# Altium project DT10965_MOTOR_CONTROLLER.PrjPcb (part 7 of 8)

## Sheet Pressure_sensor_AFE3.SchDoc: =DT_SCH_Title
size A4; Organization: Droid Technologies; DocumentNumber: DT10965; Revision: 1.0; SheetNumber: 15; SheetTotal: 22
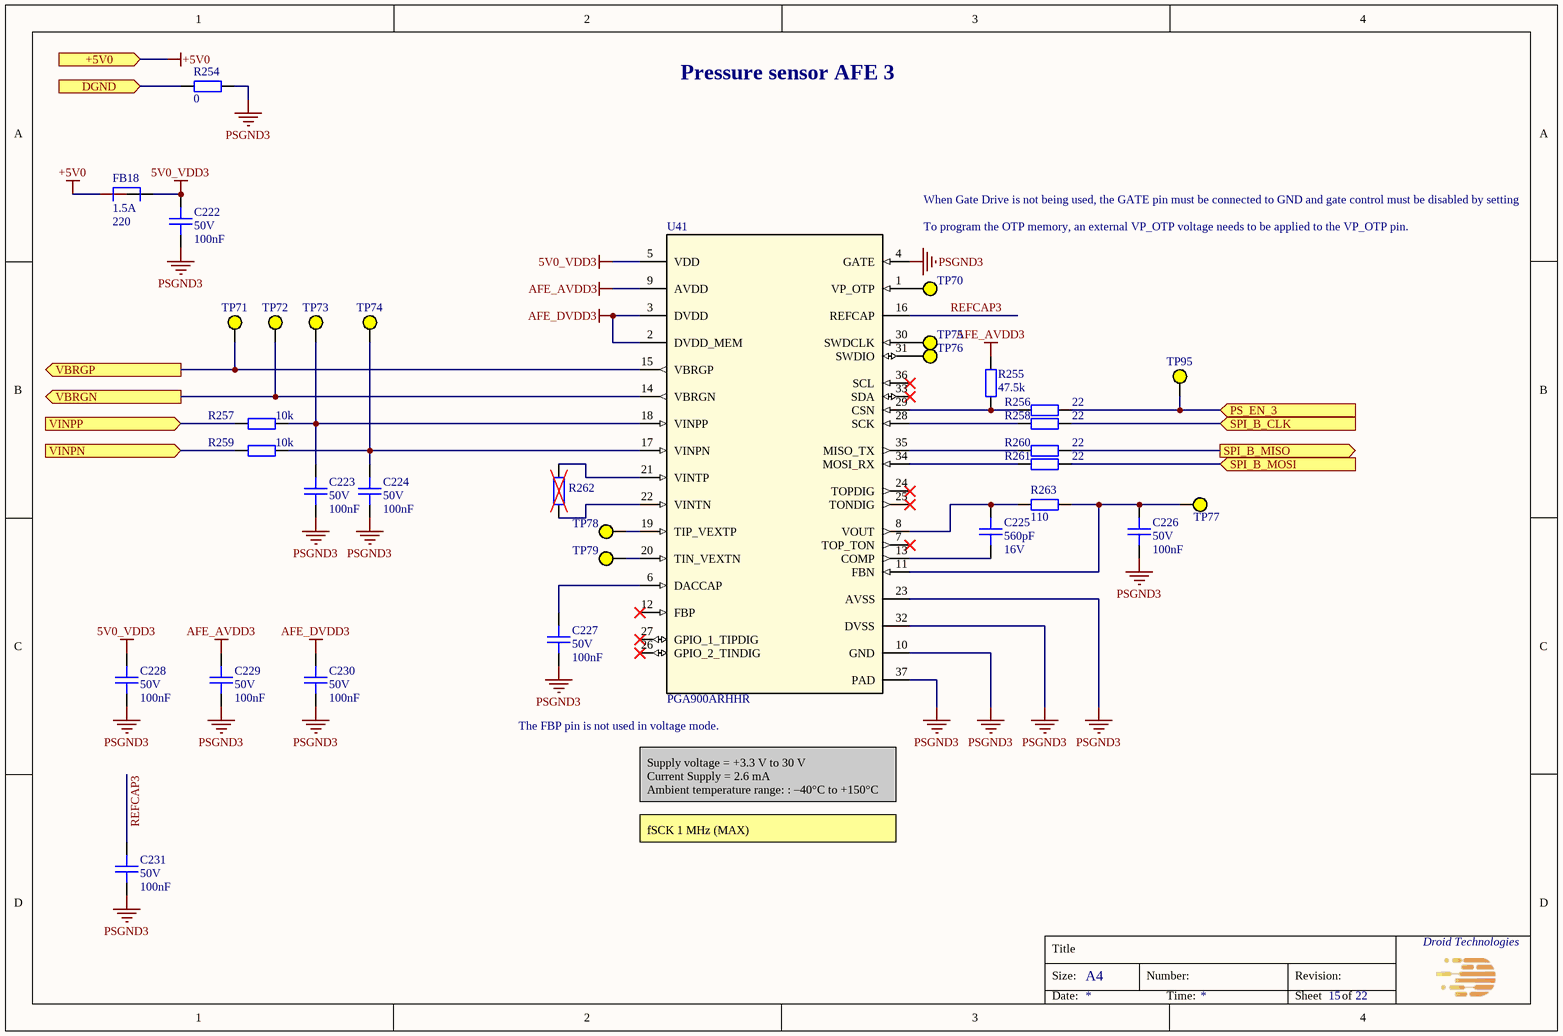
[diagram p16: Pressure_sensor_AFE3.SchDoc]

### Parts
C222  Voltage Rating: 50V  Capacitance: 100nF  [CAPC100x50x50L25]  (hidden comment: GCM155L8EH104KE07D)
C223  Voltage Rating: 50V  Capacitance: 100nF  [CAPC100x50x50L25]  (hidden comment: GCM155L8EH104KE07D)
C224  Voltage Rating: 50V  Capacitance: 100nF  [CAPC100x50x50L25]  (hidden comment: GCM155L8EH104KE07D)
C225  Capacitance: 560pF  Voltage Rating: 16V  [CAPC100x50x50L25]  (hidden comment: C0402C561F4HACAUTO)
C226  Voltage Rating: 50V  Capacitance: 100nF  [CAPC100x50x50L25]  (hidden comment: GCM155L8EH104KE07D)
C227  Voltage Rating: 50V  Capacitance: 100nF  [CAPC100x50x50L25]  (hidden comment: GCM155L8EH104KE07D)
C228  Voltage Rating: 50V  Capacitance: 100nF  [CAPC100x50x50L25]  (hidden comment: GCM155L8EH104KE07D)
C229  Voltage Rating: 50V  Capacitance: 100nF  [CAPC100x50x50L25]  (hidden comment: GCM155L8EH104KE07D)
C230  Voltage Rating: 50V  Capacitance: 100nF  [CAPC100x50x50L25]  (hidden comment: GCM155L8EH104KE07D)
C231  Voltage Rating: 50V  Capacitance: 100nF  [CAPC100x50x50L25]  (hidden comment: GCM155L8EH104KE07D)
FB18  Imax: 1.5A  Impedance: 220  [BEADC160X80X95L40]  (hidden comment: BLM18KG221BH1D)
R254  Resistance: 0  [RESC160X80X55L30]  (hidden comment: RC0603FR-070RL)
R255  Resistance: 47.5k  [RESC100X50X40L25]  (hidden comment: RC0402FR-0747K5L)
R256  Resistance: 22  [RESC100X50X40L25]  (hidden comment: RC0402FR-0722RL)
R257  Resistance: 10k  [RESC100X50X40L25]  (hidden comment: RC0402FR-0710KL)
R258  Resistance: 22  [RESC100X50X40L25]  (hidden comment: RC0402FR-0722RL)
R259  Resistance: 10k  [RESC100X50X40L25]  (hidden comment: RC0402FR-0710KL)
R260  Resistance: 22  [RESC100X50X40L25]  (hidden comment: RC0402FR-0722RL)
R261  Resistance: 22  [RESC100X50X40L25]  (hidden comment: RC0402FR-0722RL)
R262  DNP chip res 0603  [RESC160X80X55L30]  (value not drawn)
R263  Resistance: 110  [RESC100X50X40L25]  (hidden comment: RC0402FR-07110RL)
TP70  Test Point  [TP_D1.5mm]  (value not drawn)  (no BOM)
TP71  Test Point  [TP_D0.75mm]  (value not drawn)  (no BOM)
TP72  Test Point  [TP_D0.75mm]  (value not drawn)  (no BOM)
TP73  Test Point  [TP_D0.75mm]  (value not drawn)  (no BOM)
TP74  Test Point  [TP_D0.75mm]  (value not drawn)  (no BOM)
TP75  Test Point  [TP_D1.5mm]  (value not drawn)  (no BOM)
TP76  Test Point  [TP_D1.5mm]  (value not drawn)  (no BOM)
TP77  Test Point  [TP_D0.75mm]  (value not drawn)  (no BOM)
TP78  Test Point  [TP_D1.5mm]  (value not drawn)  (no BOM)
TP79  Test Point  [TP_D1.5mm]  (value not drawn)  (no BOM)
TP95  Test Point  [TP_D0.75mm]  (value not drawn)  (no BOM)
U41  PGA900ARHHR  [36VQFN]

### Ports
+5V0 (in), DGND (in), PS_EN_3 (in), SPI_B_CLK (in), SPI_B_MISO (out), SPI_B_MOSI (in), VBRGN (out), VBRGP (out), VINPN (in), VINPP (in)

### Nets
5V0_VDD3: C222.2 C228.2 FB18.2 U41.5(VDD)
+5V0: FB18.1 ; port +5V0
AFE_AVDD3: C229.2 R255.2 U41.9(AVDD)
AFE_DVDD3: C230.2 U41.2(DVDD_MEM) U41.3(DVDD)
DGND: R254.2 ; port DGND
PSGND3: C222.1 C223.1 C224.1 C226.1 C227.1 C228.1 C229.1 C230.1 C231.1 R254.1 U41.4(GATE) U41.10(GND) U41.23(AVSS) U41.32(DVSS) U41.37(PAD)
PS_EN_3: R256.2 TP95.1 ; port PS_EN_3
REFCAP3: C231.2 U41.16(REFCAP)
SPI_B_CLK: R258.2 ; port SPI_B_CLK
SPI_B_MISO: R260.2 ; port SPI_B_MISO
SPI_B_MOSI: R261.2 ; port SPI_B_MOSI
NetC223_2: C223.2 R257.2 TP73.1 U41.18(VINPP)
NetC224_2: C224.2 R259.2 TP74.1 U41.17(VINPN)
NetC225_1: C225.1 U41.13(COMP)
NetC225_2: C225.2 R263.1 U41.8(VOUT)
NetC226_2: C226.2 R263.2 TP77.1 U41.11(FBN)
NetC227_2: C227.2 U41.6(DACCAP)
NetR255_1: R255.1 R256.1 U41.29(CSN)
NetR257_1: R257.1 ; port VINPP
NetR258_1: R258.1 U41.28(SCK)
NetR259_1: R259.1 ; port VINPN
NetR260_1: R260.1 U41.35(MISO_TX)
NetR261_1: R261.1 U41.34(MOSI_RX)
NetR262_1: R262.1 U41.22(VINTN)
NetR262_2: R262.2 U41.21(VINTP)
NetTP70_1: TP70.1 U41.1(VP_OTP)
NetTP71_1: TP71.1 U41.15(VBRGP) ; port VBRGP
NetTP72_1: TP72.1 U41.14(VBRGN) ; port VBRGN
NetTP75_1: TP75.1 U41.30(SWDCLK)
NetTP76_1: TP76.1 U41.31(SWDIO)
NetTP78_1: TP78.1 U41.19(TIP_VEXTP)
NetTP79_1: TP79.1 U41.20(TIN_VEXTN)

Not connected (* = marked no-connect by the designer): U41 7(TOP_TON)* 12(FBP)* 24(TOPDIG)* 25(TONDIG)* 26(GPIO_2_TINDIG)* 27(GPIO_1_TIPDIG)* 33(SDA)* 36(SCL)*

### Notes on the sheet
- Pressure sensor AFE 3
- To program the OTP memory, an external VP_OTP voltage needs to be applied to the VP_OTP pin.
- When Gate Drive is not being used, the GATE pin must be connected to GND and gate control must be disabled by setting
- (near U41) The FBP pin is not used in voltage mode.
- Supply voltage = +3.3 V to 30 V
  Current Supply = 2.6 mA
  Ambient temperature range: : –40°C to +150°C
- fSCK 1 MHz (MAX)
- Title
- Size:
- A4
- Number:
- Revision:
- Date:
- Time:
- Sheet
- of

### Library data of the parts
C222-C224 C226-C231 = CMP-001-1980-2: as C174 on sheet Power_management; Height max: 550µm; ComponentLink3Description: Digikey; Mounting Type: SM; ComponentLink3URL: https://www.digikey.com/en/products/detail/murata-electronics/GCM155L8EH104KE07D/11618823; Package: 0402 (1005 Metric); Lead Spacing: 0mm; MPN: GCM155L8EH104KE07D; Size: 1.00mm x 0.50mm; Ratings: AEC-Q200; ComponentLink1URL: https://www.murata.com/en-us/products/productdetail?partno=GCM155L8EH104KE07%23; ComponentLink1Description: Datasheet; Dielectric: X8L; ComponentLink2Description: Mouser; ComponentLink2URL: https://eu.mouser.com/ProductDetail/Murata-Electronics/GCM155L8EH104KE07D?qs=1mbolxNpo8fQSHf0HYnZWw%3D%3D
C225 = CMP-001-2011-2: as C215 on sheet Pressure_sensor_AFE2; Package: 0402 (1005 Metric); MPN: C0402C561F4HACAUTO; ComponentLink3Description: Digikey; Mounting Type: SM; Height max: 550µm; Lead Spacing: 0mm; ComponentLink1Description: Datasheet; ComponentLink3URL: https://www.digikey.com/en/products/detail/kemet/C0402C561F4HACAUTO/7955183?s=N4IgjCBcpgbFoDGUBmBDANgZwKYBoQB7KAbRAGYBOMAVgA4QBdAgBwBcoQBlNgJwEsAdgHMQAXwJgA7AhDJI6bPiKkQAFgBMGzfGYh2nHgJHiCGmhtnzFuAsUhltGyuQh6DkbnyGiJ4SnSUVqiYtioOIAAMTH4akWpB0HIhSnaqNLCRAAQsAGJMrByeAKqC-GwA8igAsjhoWACuvDimIAC0lknyfA3K9mQ0MbHpmSwoMUA; ComponentLink2URL: https://eu.mouser.com/ProductDetail/KEMET/C0402C561F4HACAUTO?qs=j%252B1pi9TdxUZljUlO6hXHJQ%3D%3D; ComponentLink2Description: Mouser; ComponentLink1URL: https://www.kemet.com/en/us/product/C0402C561F4HACAUTO.html; Ratings: AEC-Q200; Size: 1.00mm x 0.50mm
FB18 = CMP-001-1981-1: as FB15 on sheet Power_management; Mounting Type: SM; Size: 1.60mm x 0.80mm; ComponentLink2URL: https://eu.mouser.com/ProductDetail/Murata-Electronics/BLM18KG221BH1D?qs=sJ5gq5MLFXpgEHYBdWUtkQ%3D%3D; ComponentLink1Description: Datasheet; ComponentLink1URL: https://www.murata.com/en-us/products/productdata/8798137286686/QNFA9129.pdf; Lead Spacing: 0mm; Ratings: AEC-Q200; ComponentLink3Description: Digikey; ComponentLink3URL: https://www.digikey.com/en/products/detail/murata-electronics/BLM18KG221BH1D/6156000; Height max: 950µm; Package: 0603 (1608 Metric); ComponentLink2Description: Mouser; MPN: BLM18KG221BH1D
R254 = CMP-001-0927-2: as R244 on sheet Pressure_sensor_AFE2; Height max: 550µm; ComponentLink2URL: https://eu.mouser.com/ProductDetail/YAGEO/RC0603FR-070RL?qs=0yPvnVz5%2FmpDQv43TwvCfw%3D%3D; Temperature Coefficient: -; ComponentLink3Description: Digikey; ComponentLink2Description: Mouser; MPN: RC0603FR-070RL; ComponentLink1URL: https://www.yageo.com/upload/media/product/productsearch/datasheet/rchip/PYu-RC_Group_51_RoHS_L_12.pdf; Ratings: -; Size: 1.60mm x 0.80mm; Composition: Thick Film; Mounting Type: SM; ComponentLink3URL: https://www.digikey.com/en/products/detail/yageo/RC0603FR-070RL/1304008; Package: 0603 (1608 Metric); ComponentLink1Description: Datasheet
R255 = CMP-001-0277-7: as R245 on sheet Pressure_sensor_AFE2; ComponentLink1URL: https://www.yageo.com/upload/media/product/productsearch/datasheet/rchip/PYu-RC_Group_51_RoHS_L_12.pdf; ComponentLink1Description: Datasheet; MPN: RC0402FR-0747K5L; ComponentLink3Description: Digikey; ComponentLink2URL: https://eu.mouser.com/ProductDetail/YAGEO/RC0402FR-0747K5L?qs=V1yeUXFNrklfu86Rfgihxg%3D%3D; Mounting Type: SM; Tolerance: 1%; Package: 0402 (1005 Metric); Height max: 400µm; ComponentLink2Description: Mouser; ComponentLink3URL: https://www.digikey.com/en/products/detail/yageo/RC0402FR-0747K5L/726617; Size: 1.00mm x 0.50mm; Composition: Thick Film; Ratings: -
R256 R258 R260 R261 = CMP-001-0482-4: as R208 on sheet Power_management; Ratings: -; ComponentLink3URL: https://www.digikey.com/en/products/detail/yageo/RC0402FR-0722RL/726562; ComponentLink2URL: https://eu.mouser.com/ProductDetail/YAGEO/RC0402FR-0722RL?qs=V1yeUXFNrkkRg6zf08ADKQ%3D%3D; MPN: RC0402FR-0722RL; ComponentLink1Description: Datasheet; ComponentLink3Description: Digikey; Tolerance: 1%; Size: 1.00mm x 0.50mm; ComponentLink1URL: https://www.yageo.com/upload/media/product/productsearch/datasheet/rchip/PYu-RC_Group_51_RoHS_L_12.pdf; Composition: Thick Film; ComponentLink2Description: Mouser; Mounting Type: SM; Package: 0402 (1005 Metric); Height max: 400µm
R257 R259 = CMP-00010-6: as R247 on sheet Pressure_sensor_AFE2; ComponentLink3URL: https://www.digikey.com/en/products/detail/yageo/RC0402FR-0710KL/726523; ComponentLink1Description: Datasheet; Height max: 400µm; ComponentLink3Description: Digikey; ComponentLink2URL: https://www2.mouser.com/ProductDetail/YAGEO/RC0402FR-0710KL?qs=%2Fha2pyFaduhjtLcYvKXQ8NAGbRXkQ%2Fwl6RsvWHeV66MSeqLhkcF3rg%3D%3D; Ratings: -; MPN: RC0402FR-0710KL; ComponentLink1URL: https://www.yageo.com/upload/media/product/productsearch/datasheet/rchip/PYu-RC_Group_51_RoHS_L_12.pdf; ComponentLink2Description: Mouser; Mounting Type: SM; Tolerance: 1%; Composition: Thick Film; Size: 1.00mm x 0.50mm; Package: 0402 (1005 Metric)
R262 = CMP-001-0920-3: DNP res 0603; Mounting Type: SM; MPN: DNP; Package: 0603 (1608 Metric)
R263 = CMP-001-0497-6: as R253 on sheet Pressure_sensor_AFE2; Size: 1.00mm x 0.50mm; ComponentLink1Description: Datasheet; Package: 0402 (1005 Metric); ComponentLink2URL: https://eu.mouser.com/ProductDetail/YAGEO/RC0402FR-07110RL?qs=QWYorlrD8IXj7iGvwWbRbA%3D%3D; MPN: RC0402FR-07110RL; ComponentLink3Description: Digikey; Height max: 400µm; Ratings: -; ComponentLink3URL: https://www.digikey.com/en/products/detail/yageo/RC0402FR-07110RL/2827583; Composition: Thick Film; ComponentLink2Description: Mouser; Tolerance: 1%; Mounting Type: SM; ComponentLink1URL: https://www.yageo.com/upload/media/product/productsearch/datasheet/rchip/PYu-RC_Group_51_RoHS_L_12.pdf
TP70 TP75 TP76 TP78 TP79 = TP_1.5
TP71-TP74 TP77 TP95 = TP_0.75: Test point 0.75mm
U41 = PGA900ARHHR: as U40 on sheet Pressure_sensor_AFE2; MPN: PGA900ARHHR

## Sheet PGA900_AFE_Reserved_4.SchDoc: =DT_SCH_Title
size A4; Organization: Droid Technologies; DocumentNumber: DT10965; Revision: 1.0; SheetNumber: 16; SheetTotal: 22
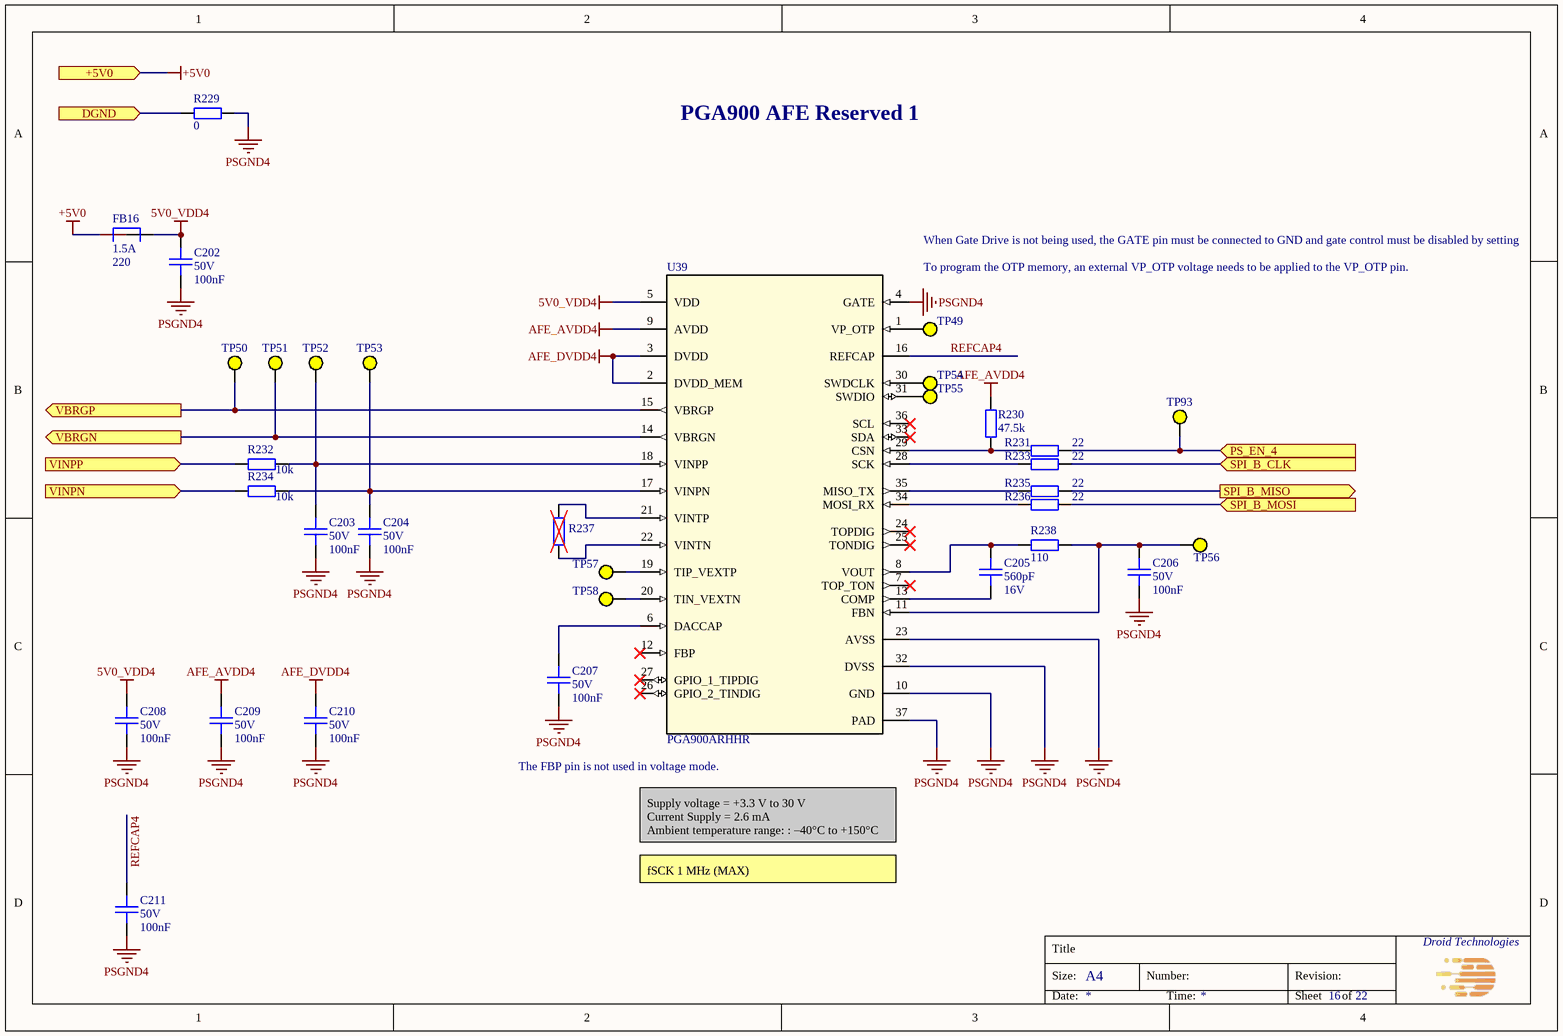
[diagram p17: PGA900_AFE_Reserved_4.SchDoc]

### Parts
C202  Voltage Rating: 50V  Capacitance: 100nF  [CAPC100x50x50L25]  (hidden comment: GCM155L8EH104KE07D)
C203  Voltage Rating: 50V  Capacitance: 100nF  [CAPC100x50x50L25]  (hidden comment: GCM155L8EH104KE07D)
C204  Voltage Rating: 50V  Capacitance: 100nF  [CAPC100x50x50L25]  (hidden comment: GCM155L8EH104KE07D)
C205  Capacitance: 560pF  Voltage Rating: 16V  [CAPC100x50x50L25]  (hidden comment: C0402C561F4HACAUTO)
C206  Voltage Rating: 50V  Capacitance: 100nF  [CAPC100x50x50L25]  (hidden comment: GCM155L8EH104KE07D)
C207  Voltage Rating: 50V  Capacitance: 100nF  [CAPC100x50x50L25]  (hidden comment: GCM155L8EH104KE07D)
C208  Voltage Rating: 50V  Capacitance: 100nF  [CAPC100x50x50L25]  (hidden comment: GCM155L8EH104KE07D)
C209  Voltage Rating: 50V  Capacitance: 100nF  [CAPC100x50x50L25]  (hidden comment: GCM155L8EH104KE07D)
C210  Voltage Rating: 50V  Capacitance: 100nF  [CAPC100x50x50L25]  (hidden comment: GCM155L8EH104KE07D)
C211  Voltage Rating: 50V  Capacitance: 100nF  [CAPC100x50x50L25]  (hidden comment: GCM155L8EH104KE07D)
FB16  Imax: 1.5A  Impedance: 220  [BEADC160X80X95L40]  (hidden comment: BLM18KG221BH1D)
R229  Resistance: 0  [RESC160X80X55L30]  (hidden comment: RC0603FR-070RL)
R230  Resistance: 47.5k  [RESC100X50X40L25]  (hidden comment: RC0402FR-0747K5L)
R231  Resistance: 22  [RESC100X50X40L25]  (hidden comment: RC0402FR-0722RL)
R232  Resistance: 10k  [RESC100X50X40L25]  (hidden comment: RC0402FR-0710KL)
R233  Resistance: 22  [RESC100X50X40L25]  (hidden comment: RC0402FR-0722RL)
R234  Resistance: 10k  [RESC100X50X40L25]  (hidden comment: RC0402FR-0710KL)
R235  Resistance: 22  [RESC100X50X40L25]  (hidden comment: RC0402FR-0722RL)
R236  Resistance: 22  [RESC100X50X40L25]  (hidden comment: RC0402FR-0722RL)
R237  DNP chip res 0603  [RESC160X80X55L30]  (value not drawn)
R238  Resistance: 110  [RESC100X50X40L25]  (hidden comment: RC0402FR-07110RL)
TP49  Test Point  [TP_D1.5mm]  (value not drawn)  (no BOM)
TP50  Test Point  [TP_D0.75mm]  (value not drawn)  (no BOM)
TP51  Test Point  [TP_D0.75mm]  (value not drawn)  (no BOM)
TP52  Test Point  [TP_D0.75mm]  (value not drawn)  (no BOM)
TP53  Test Point  [TP_D0.75mm]  (value not drawn)  (no BOM)
TP54  Test Point  [TP_D1.5mm]  (value not drawn)  (no BOM)
TP55  Test Point  [TP_D1.5mm]  (value not drawn)  (no BOM)
TP56  Test Point  [TP_D0.75mm]  (value not drawn)  (no BOM)
TP57  Test Point  [TP_D1.5mm]  (value not drawn)  (no BOM)
TP58  Test Point  [TP_D1.5mm]  (value not drawn)  (no BOM)
TP93  Test Point  [TP_D0.75mm]  (value not drawn)  (no BOM)
U39  PGA900ARHHR  [36VQFN]

### Ports
+5V0 (in), DGND (in), PS_EN_4 (in), SPI_B_CLK (in), SPI_B_MISO (out), SPI_B_MOSI (in), VBRGN (out), VBRGP (out), VINPN (in), VINPP (in)

### Nets
5V0_VDD4: C202.2 C208.2 FB16.2 U39.5(VDD)
+5V0: FB16.1 ; port +5V0
AFE_AVDD4: C209.2 R230.2 U39.9(AVDD)
AFE_DVDD4: C210.2 U39.2(DVDD_MEM) U39.3(DVDD)
DGND: R229.2 ; port DGND
PSGND4: C202.1 C203.1 C204.1 C206.1 C207.1 C208.1 C209.1 C210.1 C211.1 R229.1 U39.4(GATE) U39.10(GND) U39.23(AVSS) U39.32(DVSS) U39.37(PAD)
PS_EN_4: R231.2 TP93.1 ; port PS_EN_4
REFCAP4: C211.2 U39.16(REFCAP)
SPI_B_CLK: R233.2 ; port SPI_B_CLK
SPI_B_MISO: R235.2 ; port SPI_B_MISO
SPI_B_MOSI: R236.2 ; port SPI_B_MOSI
NetC203_2: C203.2 R232.2 TP52.1 U39.18(VINPP)
NetC204_2: C204.2 R234.2 TP53.1 U39.17(VINPN)
NetC205_1: C205.1 U39.13(COMP)
NetC205_2: C205.2 R238.1 U39.8(VOUT)
NetC206_2: C206.2 R238.2 TP56.1 U39.11(FBN)
NetC207_2: C207.2 U39.6(DACCAP)
NetR230_1: R230.1 R231.1 U39.29(CSN)
NetR232_1: R232.1 ; port VINPP
NetR233_1: R233.1 U39.28(SCK)
NetR234_1: R234.1 ; port VINPN
NetR235_1: R235.1 U39.35(MISO_TX)
NetR236_1: R236.1 U39.34(MOSI_RX)
NetR237_1: R237.1 U39.22(VINTN)
NetR237_2: R237.2 U39.21(VINTP)
NetTP49_1: TP49.1 U39.1(VP_OTP)
NetTP50_1: TP50.1 U39.15(VBRGP) ; port VBRGP
NetTP51_1: TP51.1 U39.14(VBRGN) ; port VBRGN
NetTP54_1: TP54.1 U39.30(SWDCLK)
NetTP55_1: TP55.1 U39.31(SWDIO)
NetTP57_1: TP57.1 U39.19(TIP_VEXTP)
NetTP58_1: TP58.1 U39.20(TIN_VEXTN)

Not connected (* = marked no-connect by the designer): U39 7(TOP_TON)* 12(FBP)* 24(TOPDIG)* 25(TONDIG)* 26(GPIO_2_TINDIG)* 27(GPIO_1_TIPDIG)* 33(SDA)* 36(SCL)*

### Notes on the sheet
- PGA900 AFE Reserved 1
- When Gate Drive is not being used, the GATE pin must be connected to GND and gate control must be disabled by setting
- To program the OTP memory, an external VP_OTP voltage needs to be applied to the VP_OTP pin.
- (near U39) The FBP pin is not used in voltage mode.
- Supply voltage = +3.3 V to 30 V
  Current Supply = 2.6 mA
  Ambient temperature range: : –40°C to +150°C
- fSCK 1 MHz (MAX)
- Title
- Size:
- A4
- Number:
- Revision:
- Date:
- Time:
- Sheet
- of

### Library data of the parts
C202-C204 C206-C211 = CMP-001-1980-2: as C174 on sheet Power_management; Height max: 550µm; ComponentLink3Description: Digikey; Mounting Type: SM; ComponentLink3URL: https://www.digikey.com/en/products/detail/murata-electronics/GCM155L8EH104KE07D/11618823; Package: 0402 (1005 Metric); Lead Spacing: 0mm; MPN: GCM155L8EH104KE07D; Size: 1.00mm x 0.50mm; Ratings: AEC-Q200; ComponentLink1URL: https://www.murata.com/en-us/products/productdetail?partno=GCM155L8EH104KE07%23; ComponentLink1Description: Datasheet; Dielectric: X8L; ComponentLink2Description: Mouser; ComponentLink2URL: https://eu.mouser.com/ProductDetail/Murata-Electronics/GCM155L8EH104KE07D?qs=1mbolxNpo8fQSHf0HYnZWw%3D%3D
C205 = CMP-001-2011-2: as C215 on sheet Pressure_sensor_AFE2; Package: 0402 (1005 Metric); MPN: C0402C561F4HACAUTO; ComponentLink3Description: Digikey; Mounting Type: SM; Height max: 550µm; Lead Spacing: 0mm; ComponentLink1Description: Datasheet; ComponentLink3URL: https://www.digikey.com/en/products/detail/kemet/C0402C561F4HACAUTO/7955183?s=N4IgjCBcpgbFoDGUBmBDANgZwKYBoQB7KAbRAGYBOMAVgA4QBdAgBwBcoQBlNgJwEsAdgHMQAXwJgA7AhDJI6bPiKkQAFgBMGzfGYh2nHgJHiCGmhtnzFuAsUhltGyuQh6DkbnyGiJ4SnSUVqiYtioOIAAMTH4akWpB0HIhSnaqNLCRAAQsAGJMrByeAKqC-GwA8igAsjhoWACuvDimIAC0lknyfA3K9mQ0MbHpmSwoMUA; ComponentLink2URL: https://eu.mouser.com/ProductDetail/KEMET/C0402C561F4HACAUTO?qs=j%252B1pi9TdxUZljUlO6hXHJQ%3D%3D; ComponentLink2Description: Mouser; ComponentLink1URL: https://www.kemet.com/en/us/product/C0402C561F4HACAUTO.html; Ratings: AEC-Q200; Size: 1.00mm x 0.50mm
FB16 = CMP-001-1981-1: as FB15 on sheet Power_management; Mounting Type: SM; Size: 1.60mm x 0.80mm; ComponentLink2URL: https://eu.mouser.com/ProductDetail/Murata-Electronics/BLM18KG221BH1D?qs=sJ5gq5MLFXpgEHYBdWUtkQ%3D%3D; ComponentLink1Description: Datasheet; ComponentLink1URL: https://www.murata.com/en-us/products/productdata/8798137286686/QNFA9129.pdf; Lead Spacing: 0mm; Ratings: AEC-Q200; ComponentLink3Description: Digikey; ComponentLink3URL: https://www.digikey.com/en/products/detail/murata-electronics/BLM18KG221BH1D/6156000; Height max: 950µm; Package: 0603 (1608 Metric); ComponentLink2Description: Mouser; MPN: BLM18KG221BH1D
R229 = CMP-001-0927-2: as R244 on sheet Pressure_sensor_AFE2; Height max: 550µm; ComponentLink2URL: https://eu.mouser.com/ProductDetail/YAGEO/RC0603FR-070RL?qs=0yPvnVz5%2FmpDQv43TwvCfw%3D%3D; Temperature Coefficient: -; ComponentLink3Description: Digikey; ComponentLink2Description: Mouser; MPN: RC0603FR-070RL; ComponentLink1URL: https://www.yageo.com/upload/media/product/productsearch/datasheet/rchip/PYu-RC_Group_51_RoHS_L_12.pdf; Ratings: -; Size: 1.60mm x 0.80mm; Composition: Thick Film; Mounting Type: SM; ComponentLink3URL: https://www.digikey.com/en/products/detail/yageo/RC0603FR-070RL/1304008; Package: 0603 (1608 Metric); ComponentLink1Description: Datasheet
R230 = CMP-001-0277-7: as R245 on sheet Pressure_sensor_AFE2; ComponentLink1URL: https://www.yageo.com/upload/media/product/productsearch/datasheet/rchip/PYu-RC_Group_51_RoHS_L_12.pdf; ComponentLink1Description: Datasheet; MPN: RC0402FR-0747K5L; ComponentLink3Description: Digikey; ComponentLink2URL: https://eu.mouser.com/ProductDetail/YAGEO/RC0402FR-0747K5L?qs=V1yeUXFNrklfu86Rfgihxg%3D%3D; Mounting Type: SM; Tolerance: 1%; Package: 0402 (1005 Metric); Height max: 400µm; ComponentLink2Description: Mouser; ComponentLink3URL: https://www.digikey.com/en/products/detail/yageo/RC0402FR-0747K5L/726617; Size: 1.00mm x 0.50mm; Composition: Thick Film; Ratings: -
R231 R233 R235 R236 = CMP-001-0482-4: as R208 on sheet Power_management; Ratings: -; ComponentLink3URL: https://www.digikey.com/en/products/detail/yageo/RC0402FR-0722RL/726562; ComponentLink2URL: https://eu.mouser.com/ProductDetail/YAGEO/RC0402FR-0722RL?qs=V1yeUXFNrkkRg6zf08ADKQ%3D%3D; MPN: RC0402FR-0722RL; ComponentLink1Description: Datasheet; ComponentLink3Description: Digikey; Tolerance: 1%; Size: 1.00mm x 0.50mm; ComponentLink1URL: https://www.yageo.com/upload/media/product/productsearch/datasheet/rchip/PYu-RC_Group_51_RoHS_L_12.pdf; Composition: Thick Film; ComponentLink2Description: Mouser; Mounting Type: SM; Package: 0402 (1005 Metric); Height max: 400µm
R232 R234 = CMP-00010-6: as R247 on sheet Pressure_sensor_AFE2; ComponentLink3URL: https://www.digikey.com/en/products/detail/yageo/RC0402FR-0710KL/726523; ComponentLink1Description: Datasheet; Height max: 400µm; ComponentLink3Description: Digikey; ComponentLink2URL: https://www2.mouser.com/ProductDetail/YAGEO/RC0402FR-0710KL?qs=%2Fha2pyFaduhjtLcYvKXQ8NAGbRXkQ%2Fwl6RsvWHeV66MSeqLhkcF3rg%3D%3D; Ratings: -; MPN: RC0402FR-0710KL; ComponentLink1URL: https://www.yageo.com/upload/media/product/productsearch/datasheet/rchip/PYu-RC_Group_51_RoHS_L_12.pdf; ComponentLink2Description: Mouser; Mounting Type: SM; Tolerance: 1%; Composition: Thick Film; Size: 1.00mm x 0.50mm; Package: 0402 (1005 Metric)
R237 = CMP-001-0920-3: DNP res 0603; Mounting Type: SM; MPN: DNP; Package: 0603 (1608 Metric)
R238 = CMP-001-0497-6: as R253 on sheet Pressure_sensor_AFE2; Size: 1.00mm x 0.50mm; ComponentLink1Description: Datasheet; Package: 0402 (1005 Metric); ComponentLink2URL: https://eu.mouser.com/ProductDetail/YAGEO/RC0402FR-07110RL?qs=QWYorlrD8IXj7iGvwWbRbA%3D%3D; MPN: RC0402FR-07110RL; ComponentLink3Description: Digikey; Height max: 400µm; Ratings: -; ComponentLink3URL: https://www.digikey.com/en/products/detail/yageo/RC0402FR-07110RL/2827583; Composition: Thick Film; ComponentLink2Description: Mouser; Tolerance: 1%; Mounting Type: SM; ComponentLink1URL: https://www.yageo.com/upload/media/product/productsearch/datasheet/rchip/PYu-RC_Group_51_RoHS_L_12.pdf
TP49 TP54 TP55 TP57 TP58 = TP_1.5
TP50-TP53 TP56 TP93 = TP_0.75: Test point 0.75mm
U39 = PGA900ARHHR: as U40 on sheet Pressure_sensor_AFE2; MPN: PGA900ARHHR

## Sheet PGA900_AFE_Reserved_5.SchDoc: =DT_SCH_Title
size A4; Organization: Droid Technologies; DocumentNumber: DT10965; Revision: 1.0; SheetNumber: 17; SheetTotal: 22
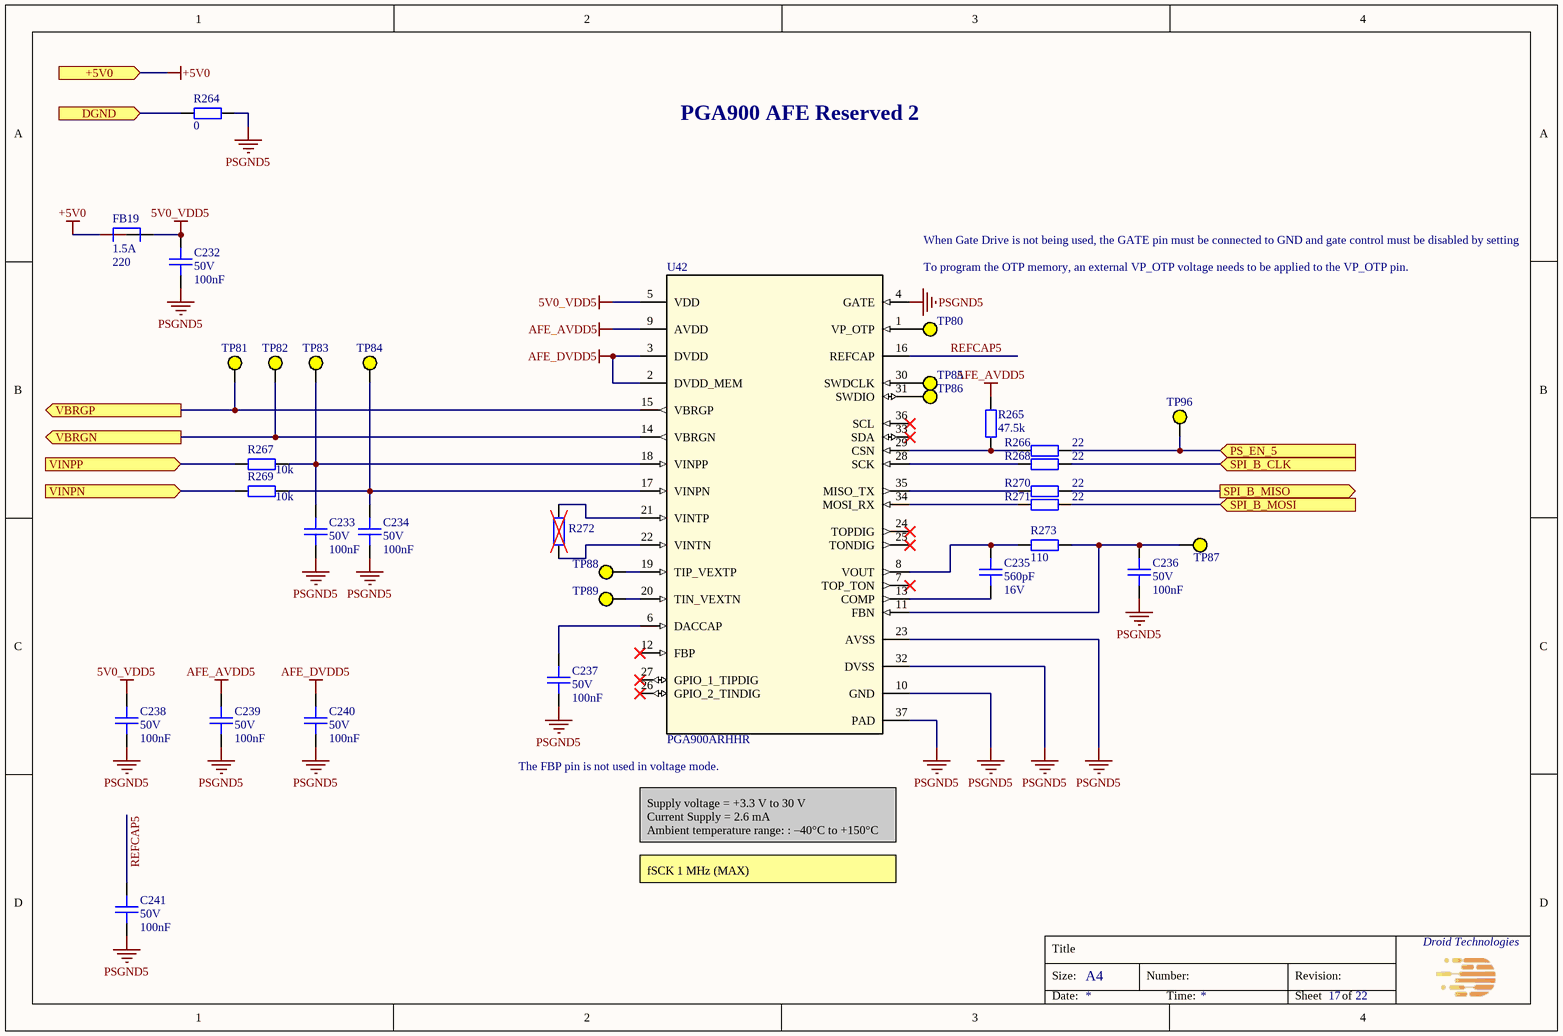
[diagram p18: PGA900_AFE_Reserved_5.SchDoc]

### Parts
C232  Voltage Rating: 50V  Capacitance: 100nF  [CAPC100x50x50L25]  (hidden comment: GCM155L8EH104KE07D)
C233  Voltage Rating: 50V  Capacitance: 100nF  [CAPC100x50x50L25]  (hidden comment: GCM155L8EH104KE07D)
C234  Voltage Rating: 50V  Capacitance: 100nF  [CAPC100x50x50L25]  (hidden comment: GCM155L8EH104KE07D)
C235  Capacitance: 560pF  Voltage Rating: 16V  [CAPC100x50x50L25]  (hidden comment: C0402C561F4HACAUTO)
C236  Voltage Rating: 50V  Capacitance: 100nF  [CAPC100x50x50L25]  (hidden comment: GCM155L8EH104KE07D)
C237  Voltage Rating: 50V  Capacitance: 100nF  [CAPC100x50x50L25]  (hidden comment: GCM155L8EH104KE07D)
C238  Voltage Rating: 50V  Capacitance: 100nF  [CAPC100x50x50L25]  (hidden comment: GCM155L8EH104KE07D)
C239  Voltage Rating: 50V  Capacitance: 100nF  [CAPC100x50x50L25]  (hidden comment: GCM155L8EH104KE07D)
C240  Voltage Rating: 50V  Capacitance: 100nF  [CAPC100x50x50L25]  (hidden comment: GCM155L8EH104KE07D)
C241  Voltage Rating: 50V  Capacitance: 100nF  [CAPC100x50x50L25]  (hidden comment: GCM155L8EH104KE07D)
FB19  Imax: 1.5A  Impedance: 220  [BEADC160X80X95L40]  (hidden comment: BLM18KG221BH1D)
R264  Resistance: 0  [RESC160X80X55L30]  (hidden comment: RC0603FR-070RL)
R265  Resistance: 47.5k  [RESC100X50X40L25]  (hidden comment: RC0402FR-0747K5L)
R266  Resistance: 22  [RESC100X50X40L25]  (hidden comment: RC0402FR-0722RL)
R267  Resistance: 10k  [RESC100X50X40L25]  (hidden comment: RC0402FR-0710KL)
R268  Resistance: 22  [RESC100X50X40L25]  (hidden comment: RC0402FR-0722RL)
R269  Resistance: 10k  [RESC100X50X40L25]  (hidden comment: RC0402FR-0710KL)
R270  Resistance: 22  [RESC100X50X40L25]  (hidden comment: RC0402FR-0722RL)
R271  Resistance: 22  [RESC100X50X40L25]  (hidden comment: RC0402FR-0722RL)
R272  DNP chip res 0603  [RESC160X80X55L30]  (value not drawn)
R273  Resistance: 110  [RESC100X50X40L25]  (hidden comment: RC0402FR-07110RL)
TP80  Test Point  [TP_D1.5mm]  (value not drawn)  (no BOM)
TP81  Test Point  [TP_D0.75mm]  (value not drawn)  (no BOM)
TP82  Test Point  [TP_D0.75mm]  (value not drawn)  (no BOM)
TP83  Test Point  [TP_D0.75mm]  (value not drawn)  (no BOM)
TP84  Test Point  [TP_D0.75mm]  (value not drawn)  (no BOM)
TP85  Test Point  [TP_D1.5mm]  (value not drawn)  (no BOM)
TP86  Test Point  [TP_D1.5mm]  (value not drawn)  (no BOM)
TP87  Test Point  [TP_D0.75mm]  (value not drawn)  (no BOM)
TP88  Test Point  [TP_D1.5mm]  (value not drawn)  (no BOM)
TP89  Test Point  [TP_D1.5mm]  (value not drawn)  (no BOM)
TP96  Test Point  [TP_D0.75mm]  (value not drawn)  (no BOM)
U42  PGA900ARHHR  [36VQFN]

### Ports
+5V0 (in), DGND (in), PS_EN_5 (in), SPI_B_CLK (in), SPI_B_MISO (out), SPI_B_MOSI (in), VBRGN (out), VBRGP (out), VINPN (in), VINPP (in)

### Nets
5V0_VDD5: C232.2 C238.2 FB19.2 U42.5(VDD)
+5V0: FB19.1 ; port +5V0
AFE_AVDD5: C239.2 R265.2 U42.9(AVDD)
AFE_DVDD5: C240.2 U42.2(DVDD_MEM) U42.3(DVDD)
DGND: R264.2 ; port DGND
PSGND5: C232.1 C233.1 C234.1 C236.1 C237.1 C238.1 C239.1 C240.1 C241.1 R264.1 U42.4(GATE) U42.10(GND) U42.23(AVSS) U42.32(DVSS) U42.37(PAD)
PS_EN_5: R266.2 TP96.1 ; port PS_EN_5
REFCAP5: C241.2 U42.16(REFCAP)
SPI_B_CLK: R268.2 ; port SPI_B_CLK
SPI_B_MISO: R270.2 ; port SPI_B_MISO
SPI_B_MOSI: R271.2 ; port SPI_B_MOSI
NetC233_2: C233.2 R267.2 TP83.1 U42.18(VINPP)
NetC234_2: C234.2 R269.2 TP84.1 U42.17(VINPN)
NetC235_1: C235.1 U42.13(COMP)
NetC235_2: C235.2 R273.1 U42.8(VOUT)
NetC236_2: C236.2 R273.2 TP87.1 U42.11(FBN)
NetC237_2: C237.2 U42.6(DACCAP)
NetR265_1: R265.1 R266.1 U42.29(CSN)
NetR267_1: R267.1 ; port VINPP
NetR268_1: R268.1 U42.28(SCK)
NetR269_1: R269.1 ; port VINPN
NetR270_1: R270.1 U42.35(MISO_TX)
NetR271_1: R271.1 U42.34(MOSI_RX)
NetR272_1: R272.1 U42.22(VINTN)
NetR272_2: R272.2 U42.21(VINTP)
NetTP80_1: TP80.1 U42.1(VP_OTP)
NetTP81_1: TP81.1 U42.15(VBRGP) ; port VBRGP
NetTP82_1: TP82.1 U42.14(VBRGN) ; port VBRGN
NetTP85_1: TP85.1 U42.30(SWDCLK)
NetTP86_1: TP86.1 U42.31(SWDIO)
NetTP88_1: TP88.1 U42.19(TIP_VEXTP)
NetTP89_1: TP89.1 U42.20(TIN_VEXTN)

Not connected (* = marked no-connect by the designer): U42 7(TOP_TON)* 12(FBP)* 24(TOPDIG)* 25(TONDIG)* 26(GPIO_2_TINDIG)* 27(GPIO_1_TIPDIG)* 33(SDA)* 36(SCL)*

### Notes on the sheet
- PGA900 AFE Reserved 2
- When Gate Drive is not being used, the GATE pin must be connected to GND and gate control must be disabled by setting
- To program the OTP memory, an external VP_OTP voltage needs to be applied to the VP_OTP pin.
- (near U42) The FBP pin is not used in voltage mode.
- Supply voltage = +3.3 V to 30 V
  Current Supply = 2.6 mA
  Ambient temperature range: : –40°C to +150°C
- fSCK 1 MHz (MAX)
- Title
- Size:
- A4
- Number:
- Revision:
- Date:
- Time:
- Sheet
- of

### Library data of the parts
C232-C234 C236-C241 = CMP-001-1980-2: as C174 on sheet Power_management; Height max: 550µm; ComponentLink3Description: Digikey; Mounting Type: SM; ComponentLink3URL: https://www.digikey.com/en/products/detail/murata-electronics/GCM155L8EH104KE07D/11618823; Package: 0402 (1005 Metric); Lead Spacing: 0mm; MPN: GCM155L8EH104KE07D; Size: 1.00mm x 0.50mm; Ratings: AEC-Q200; ComponentLink1URL: https://www.murata.com/en-us/products/productdetail?partno=GCM155L8EH104KE07%23; ComponentLink1Description: Datasheet; Dielectric: X8L; ComponentLink2Description: Mouser; ComponentLink2URL: https://eu.mouser.com/ProductDetail/Murata-Electronics/GCM155L8EH104KE07D?qs=1mbolxNpo8fQSHf0HYnZWw%3D%3D
C235 = CMP-001-2011-2: as C215 on sheet Pressure_sensor_AFE2; Package: 0402 (1005 Metric); MPN: C0402C561F4HACAUTO; ComponentLink3Description: Digikey; Mounting Type: SM; Height max: 550µm; Lead Spacing: 0mm; ComponentLink1Description: Datasheet; ComponentLink3URL: https://www.digikey.com/en/products/detail/kemet/C0402C561F4HACAUTO/7955183?s=N4IgjCBcpgbFoDGUBmBDANgZwKYBoQB7KAbRAGYBOMAVgA4QBdAgBwBcoQBlNgJwEsAdgHMQAXwJgA7AhDJI6bPiKkQAFgBMGzfGYh2nHgJHiCGmhtnzFuAsUhltGyuQh6DkbnyGiJ4SnSUVqiYtioOIAAMTH4akWpB0HIhSnaqNLCRAAQsAGJMrByeAKqC-GwA8igAsjhoWACuvDimIAC0lknyfA3K9mQ0MbHpmSwoMUA; ComponentLink2URL: https://eu.mouser.com/ProductDetail/KEMET/C0402C561F4HACAUTO?qs=j%252B1pi9TdxUZljUlO6hXHJQ%3D%3D; ComponentLink2Description: Mouser; ComponentLink1URL: https://www.kemet.com/en/us/product/C0402C561F4HACAUTO.html; Ratings: AEC-Q200; Size: 1.00mm x 0.50mm
FB19 = CMP-001-1981-1: as FB15 on sheet Power_management; Mounting Type: SM; Size: 1.60mm x 0.80mm; ComponentLink2URL: https://eu.mouser.com/ProductDetail/Murata-Electronics/BLM18KG221BH1D?qs=sJ5gq5MLFXpgEHYBdWUtkQ%3D%3D; ComponentLink1Description: Datasheet; ComponentLink1URL: https://www.murata.com/en-us/products/productdata/8798137286686/QNFA9129.pdf; Lead Spacing: 0mm; Ratings: AEC-Q200; ComponentLink3Description: Digikey; ComponentLink3URL: https://www.digikey.com/en/products/detail/murata-electronics/BLM18KG221BH1D/6156000; Height max: 950µm; Package: 0603 (1608 Metric); ComponentLink2Description: Mouser; MPN: BLM18KG221BH1D
R264 = CMP-001-0927-2: as R244 on sheet Pressure_sensor_AFE2; Height max: 550µm; ComponentLink2URL: https://eu.mouser.com/ProductDetail/YAGEO/RC0603FR-070RL?qs=0yPvnVz5%2FmpDQv43TwvCfw%3D%3D; Temperature Coefficient: -; ComponentLink3Description: Digikey; ComponentLink2Description: Mouser; MPN: RC0603FR-070RL; ComponentLink1URL: https://www.yageo.com/upload/media/product/productsearch/datasheet/rchip/PYu-RC_Group_51_RoHS_L_12.pdf; Ratings: -; Size: 1.60mm x 0.80mm; Composition: Thick Film; Mounting Type: SM; ComponentLink3URL: https://www.digikey.com/en/products/detail/yageo/RC0603FR-070RL/1304008; Package: 0603 (1608 Metric); ComponentLink1Description: Datasheet
R265 = CMP-001-0277-7: as R245 on sheet Pressure_sensor_AFE2; ComponentLink1URL: https://www.yageo.com/upload/media/product/productsearch/datasheet/rchip/PYu-RC_Group_51_RoHS_L_12.pdf; ComponentLink1Description: Datasheet; MPN: RC0402FR-0747K5L; ComponentLink3Description: Digikey; ComponentLink2URL: https://eu.mouser.com/ProductDetail/YAGEO/RC0402FR-0747K5L?qs=V1yeUXFNrklfu86Rfgihxg%3D%3D; Mounting Type: SM; Tolerance: 1%; Package: 0402 (1005 Metric); Height max: 400µm; ComponentLink2Description: Mouser; ComponentLink3URL: https://www.digikey.com/en/products/detail/yageo/RC0402FR-0747K5L/726617; Size: 1.00mm x 0.50mm; Composition: Thick Film; Ratings: -
R266 R268 R270 R271 = CMP-001-0482-4: as R208 on sheet Power_management; Ratings: -; ComponentLink3URL: https://www.digikey.com/en/products/detail/yageo/RC0402FR-0722RL/726562; ComponentLink2URL: https://eu.mouser.com/ProductDetail/YAGEO/RC0402FR-0722RL?qs=V1yeUXFNrkkRg6zf08ADKQ%3D%3D; MPN: RC0402FR-0722RL; ComponentLink1Description: Datasheet; ComponentLink3Description: Digikey; Tolerance: 1%; Size: 1.00mm x 0.50mm; ComponentLink1URL: https://www.yageo.com/upload/media/product/productsearch/datasheet/rchip/PYu-RC_Group_51_RoHS_L_12.pdf; Composition: Thick Film; ComponentLink2Description: Mouser; Mounting Type: SM; Package: 0402 (1005 Metric); Height max: 400µm
R267 R269 = CMP-00010-6: as R247 on sheet Pressure_sensor_AFE2; ComponentLink3URL: https://www.digikey.com/en/products/detail/yageo/RC0402FR-0710KL/726523; ComponentLink1Description: Datasheet; Height max: 400µm; ComponentLink3Description: Digikey; ComponentLink2URL: https://www2.mouser.com/ProductDetail/YAGEO/RC0402FR-0710KL?qs=%2Fha2pyFaduhjtLcYvKXQ8NAGbRXkQ%2Fwl6RsvWHeV66MSeqLhkcF3rg%3D%3D; Ratings: -; MPN: RC0402FR-0710KL; ComponentLink1URL: https://www.yageo.com/upload/media/product/productsearch/datasheet/rchip/PYu-RC_Group_51_RoHS_L_12.pdf; ComponentLink2Description: Mouser; Mounting Type: SM; Tolerance: 1%; Composition: Thick Film; Size: 1.00mm x 0.50mm; Package: 0402 (1005 Metric)
R272 = CMP-001-0920-3: DNP res 0603; Mounting Type: SM; MPN: DNP; Package: 0603 (1608 Metric)
R273 = CMP-001-0497-6: as R253 on sheet Pressure_sensor_AFE2; Size: 1.00mm x 0.50mm; ComponentLink1Description: Datasheet; Package: 0402 (1005 Metric); ComponentLink2URL: https://eu.mouser.com/ProductDetail/YAGEO/RC0402FR-07110RL?qs=QWYorlrD8IXj7iGvwWbRbA%3D%3D; MPN: RC0402FR-07110RL; ComponentLink3Description: Digikey; Height max: 400µm; Ratings: -; ComponentLink3URL: https://www.digikey.com/en/products/detail/yageo/RC0402FR-07110RL/2827583; Composition: Thick Film; ComponentLink2Description: Mouser; Tolerance: 1%; Mounting Type: SM; ComponentLink1URL: https://www.yageo.com/upload/media/product/productsearch/datasheet/rchip/PYu-RC_Group_51_RoHS_L_12.pdf
TP80 TP85 TP86 TP88 TP89 = TP_1.5
TP81-TP84 TP87 TP96 = TP_0.75: Test point 0.75mm
U42 = PGA900ARHHR: as U40 on sheet Pressure_sensor_AFE2; MPN: PGA900ARHHR

## Sheet Motor Voltage AMP.SchDoc: =DT_SCH_Title
size A4; Organization: Droid Technologies; DocumentNumber: DT10965; Revision: 1.0; SheetNumber: 20; SheetTotal: 22
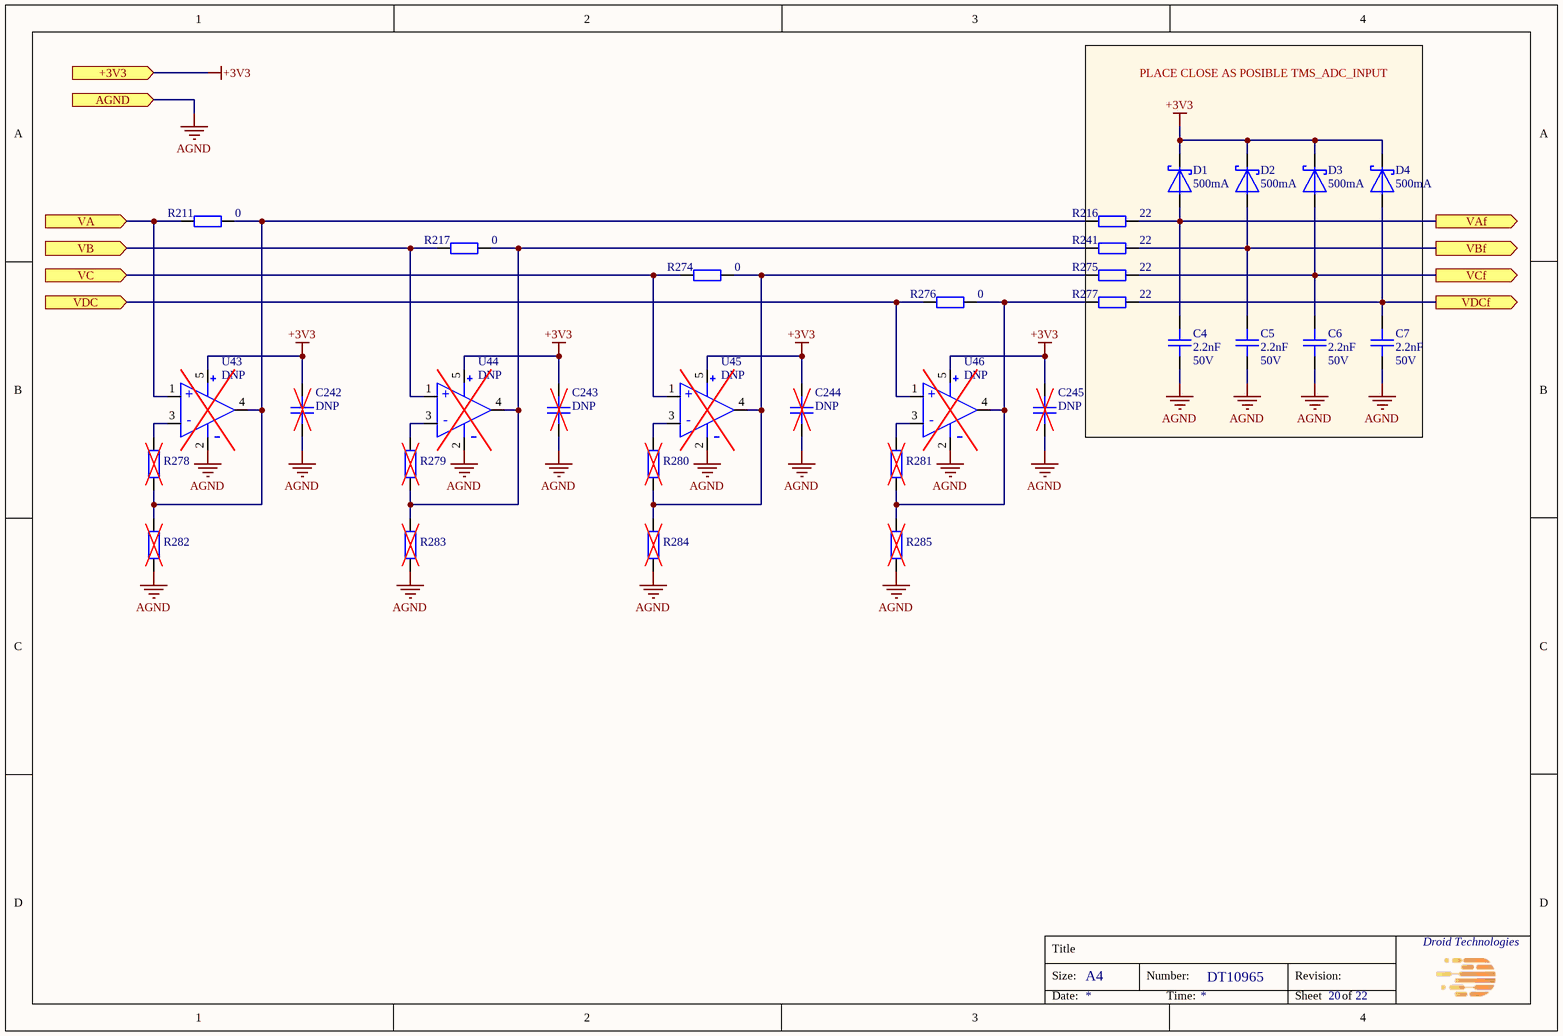
[diagram p19: Motor Voltage AMP.SchDoc]

### Parts
C4  Capacitance: 2.2nF  Voltage Rating: 50V  [CAPC100x50x50L25]  (hidden comment: CGA2B2X8R1H222K050BA)
C5  Capacitance: 2.2nF  Voltage Rating: 50V  [CAPC100x50x50L25]  (hidden comment: CGA2B2X8R1H222K050BA)
C6  Capacitance: 2.2nF  Voltage Rating: 50V  [CAPC100x50x50L25]  (hidden comment: CGA2B2X8R1H222K050BA)
C7  Capacitance: 2.2nF  Voltage Rating: 50V  [CAPC100x50x50L25]  (hidden comment: CGA2B2X8R1H222K050BA)
C242  Capacitance: DNP  [CAPC100x50x50L25]  (hidden comment: DNP chip cap 0402)
C243  Capacitance: DNP  [CAPC100x50x50L25]  (hidden comment: DNP chip cap 0402)
C244  Capacitance: DNP  [CAPC100x50x50L25]  (hidden comment: DNP chip cap 0402)
C245  Capacitance: DNP  [CAPC100x50x50L25]  (hidden comment: DNP chip cap 0402)
D1  Current - Average Rectified (Io): 500mA  [SOD365X155X135L30X57]  (hidden comment: MBR0580S1-7)
D2  Current - Average Rectified (Io): 500mA  [SOD365X155X135L30X57]  (hidden comment: MBR0580S1-7)
D3  Current - Average Rectified (Io): 500mA  [SOD365X155X135L30X57]  (hidden comment: MBR0580S1-7)
D4  Current - Average Rectified (Io): 500mA  [SOD365X155X135L30X57]  (hidden comment: MBR0580S1-7)
R211  Resistance: 0  [RESC100X50X40L25]  (hidden comment: RC0402FR-070RL)
R216  Resistance: 22  [RESC100X50X40L25]  (hidden comment: RC0402FR-0722RL)
R217  Resistance: 0  [RESC100X50X40L25]  (hidden comment: RC0402FR-070RL)
R241  Resistance: 22  [RESC100X50X40L25]  (hidden comment: RC0402FR-0722RL)
R274  Resistance: 0  [RESC100X50X40L25]  (hidden comment: RC0402FR-070RL)
R275  Resistance: 22  [RESC100X50X40L25]  (hidden comment: RC0402FR-0722RL)
R276  Resistance: 0  [RESC100X50X40L25]  (hidden comment: RC0402FR-070RL)
R277  Resistance: 22  [RESC100X50X40L25]  (hidden comment: RC0402FR-0722RL)
R278  DNP chip res 0402  [RESC100X50X40L25]  (value not drawn)
R279  DNP chip res 0402  [RESC100X50X40L25]  (value not drawn)
R280  DNP chip res 0402  [RESC100X50X40L25]  (value not drawn)
R281  DNP chip res 0402  [RESC100X50X40L25]  (value not drawn)
R282  DNP chip res 0402  [RESC100X50X40L25]  (value not drawn)
R283  DNP chip res 0402  [RESC100X50X40L25]  (value not drawn)
R284  DNP chip res 0402  [RESC100X50X40L25]  (value not drawn)
R285  DNP chip res 0402  [RESC100X50X40L25]  (value not drawn)
U43  DNP  [DCK0005A_N]
U44  DNP  [DCK0005A_N]
U45  DNP  [DCK0005A_N]
U46  DNP  [DCK0005A_N]

### Blocks framed on the sheet
PLACE CLOSE AS POSIBLE TMS_ADC_INPUT: C4-C7 D1-D4 R216 R241 R275 R277

### Ports
+3V3 (in), AGND (in), VA (in), VAf (out), VB (in), VBf (out), VC (in), VCf (out), VDC (in), VDCf (out)

### Nets
+3V3: C242.2 C243.2 C244.2 C245.2 D1.1 D2.1 D3.1 D4.1 U43.5(+V) U44.5(+V) U45.5(+V) U46.5(+V) ; port +3V3
AGND: C4.1 C5.1 C6.1 C7.1 C242.1 C243.1 C244.1 C245.1 R282.1 R283.1 R284.1 R285.1 U43.2(-V) U44.2(-V) U45.2(-V) U46.2(-V) ; port AGND
VA: R211.1 U43.1(-) ; port VA
VB: R217.1 U44.1(-) ; port VB
VC: R274.1 U45.1(-) ; port VC
VDC: R276.1 U46.1(-) ; port VDC
NetC4_2: C4.2 D1.2 R216.2 ; port VAf
NetC5_2: C5.2 D2.2 R241.2 ; port VBf
NetC6_2: C6.2 D3.2 R275.2 ; port VCf
NetC7_2: C7.2 D4.2 R277.2 ; port VDCf
NetR211_2: R211.2 R216.1 R278.1 R282.2 U43.4(OUT)
NetR217_2: R217.2 R241.1 R279.1 R283.2 U44.4(OUT)
NetR274_2: R274.2 R275.1 R280.1 R284.2 U45.4(OUT)
NetR276_2: R276.2 R277.1 R281.1 R285.2 U46.4(OUT)
NetR278_2: R278.2 U43.3(+)
NetR279_2: R279.2 U44.3(+)
NetR280_2: R280.2 U45.3(+)
NetR281_2: R281.2 U46.3(+)

### Notes on the sheet
- Title
- Size:
- A4
- Number:
- Revision:
- Date:
- Time:
- Sheet
- of

### Library data of the parts
C4-C7 = CMP-001-2008-2: CAP CER 2200PF 50V X8R 0402; Manufacturer: TDK Corporation; Op Temp max: 150°C; Tolerance: 10%; Op Temp min: -55°C; Size: 1.00mm x 0.50mm; ComponentLink2URL: https://eu.mouser.com/ProductDetail/TDK/CGA2B2X8R1H222K050BA?qs=NRhsANhppD9e0pyGSMWEuA%3D%3D; Lead Spacing: 0mm; ComponentLink3URL: https://www.digikey.com/en/products/detail/tdk-corporation/CGA2B2X8R1H222K050BA/2443359; Package: 0402 (1005 Metric); Dielectric: X8R; Height max: 550µm; ComponentLink1URL: https://product.tdk.com/en/search/capacitor/ceramic/mlcc/info?part_no=CGA2B2X8R1H222K050BA; ComponentLink1Description: Datasheet; Ratings: AEC-Q200; MPN: CGA2B2X8R1H222K050BA; Mounting Type: SM; ComponentLink2Description: Mouser; ComponentLink3Description: Digikey
C242-C245 = CMP-00427-4: DNP cap 0402; Mounting Type: SM; Package: 0402 (1005 Metric); MPN: DNP
D1-D4 = CMP-001-0960-4: DIODE SCHOTTKY 80V 500MA SOD123; Manufacturer: Diodes Incorporated; Voltage - Forward (Vf) (Max) @ If: 800 mV @ 500 mA; Op Temp max: 175°C; Capacitance: 15pF; Op Temp min: -55°C; Reverse Recovery Time (trr): 0s; Diode Type: Schottky; ComponentLink2URL: https://eu.mouser.com/ProductDetail/Diodes-Incorporated/MBR0580S1-7?qs=jXf%2FRVhl83bQOuXZ5W6icQ%3D%3D; Mounting Type: SM; ComponentLink1Description: Datasheet; MPN: MBR0580S1-7; ComponentLink1URL: https://mm.digikey.com/Volume0/opasdata/d220001/medias/docus/2174/MBR0580S1_R5.pdf; ComponentLink3URL: https://www.digikey.com/en/products/detail/diodes-incorporated/MBR0580S1-7/5080335; Size: 3.65mm x 1.55mm; Voltage - DC Reverse (Vr) (Max): 80V; ComponentLink3Description: Digikey; Package: SOD-123; Height max: 1.35mm; ComponentLink2Description: Mouser
R211 R217 R274 R276 = CMP-001-0208-12: as R6 on sheet Power_management; ComponentLink3URL: https://www.digikey.com/en/products/detail/yageo/RC0402FR-070RL/2827570; ComponentLink1Description: Datasheet; Composition: Thick Film; ComponentLink1URL: https://www.yageo.com/upload/media/product/productsearch/datasheet/rchip/PYu-RC_Group_51_RoHS_L_12.pdf; ComponentLink3Description: Digikey; Size: 1.00mm x 0.50mm; ComponentLink2Description: Mouser; Ratings: -; Package: 0402 (1005 Metric); MPN: RC0402FR-070RL; ComponentLink2URL: https://eu.mouser.com/ProductDetail/YAGEO/RC0402FR-070RL?qs=%2Fha2pyFaduhjtLcYvKXQ8C3M6h5LO%252B8bxxSVLF2BfkIYKpoExpS33A%3D%3D; Height max: 400µm; Mounting Type: SM
R216 R241 R275 R277 = CMP-001-0482-4: as R208 on sheet Power_management; Ratings: -; ComponentLink3URL: https://www.digikey.com/en/products/detail/yageo/RC0402FR-0722RL/726562; ComponentLink2URL: https://eu.mouser.com/ProductDetail/YAGEO/RC0402FR-0722RL?qs=V1yeUXFNrkkRg6zf08ADKQ%3D%3D; MPN: RC0402FR-0722RL; ComponentLink1Description: Datasheet; ComponentLink3Description: Digikey; Tolerance: 1%; Size: 1.00mm x 0.50mm; ComponentLink1URL: https://www.yageo.com/upload/media/product/productsearch/datasheet/rchip/PYu-RC_Group_51_RoHS_L_12.pdf; Composition: Thick Film; ComponentLink2Description: Mouser; Mounting Type: SM; Package: 0402 (1005 Metric); Height max: 400µm
R278-R285 = CMP-001-0271-7: DNP res 0402; Package: 0402 (1005 Metric); Mounting Type: SM; MPN: DNP
U43-U46 = TLV9001IDCKR: Manufacturer: Texas Instruments; Current - Input Bias: 5 pA; Voltage - Input Offset: 400 µV; Current - Supply: 60µA; Current - Output / Channel: 40 mA; Voltage - Supply Span (Min): 1.8 V; Voltage - Supply Span (Max): 5 V; Output Type: Rail-to-Rail; Number of Circuits: 1; Slew Rate: 2V/µs; Gain Bandwidth Product: 1 MHz; Amplifier Type: CMOS; MPN: TLV9001IDCKR; Package: 5-TSSOP, SC-70-5, SOT-353; ComponentLink1Description: Datasheet; ComponentLink1URL: https://www.ti.com/lit/ds/symlink/tlv9001.pdf?HQS=dis-dk-null-digikeymode-dsf-pf-null-wwe&ts=1752240371634&ref_url=https%253A%252F%252Fwww.ti.com%252Fgeneral%252Fdocs%252Fsuppproductinfo.tsp%253FdistId%253D10%2526gotoUrl%253Dhttps%253A%252F%252Fwww.ti.com%252Flit%252Fgpn%252Ftlv9001; ComponentLink2Description: DigiKey; ComponentLink2URL: https://www.digikey.com/en/products/detail/texas-instruments/TLV9001IDCKR/9771968; ComponentLink3Description: Mouser; ComponentLink3URL: https://eu.mouser.com/ProductDetail/Texas-Instruments/TLV9001IDCKR?qs=gTYE2QTfZfQi9B6MdkRepg%3D%3D; Mounting Type: SM; Operating Temperature (MIN): -40°C (TA); Operating Temperature (MAX): +125°C (TA)

## Sheet Wiring_connection_scheme_J2.SchDoc: =DT_SCH_Title
size A4; Organization: Droid Technologies; DocumentNumber: DT10965; Revision: 1.0; SheetNumber: 21; SheetTotal: 22
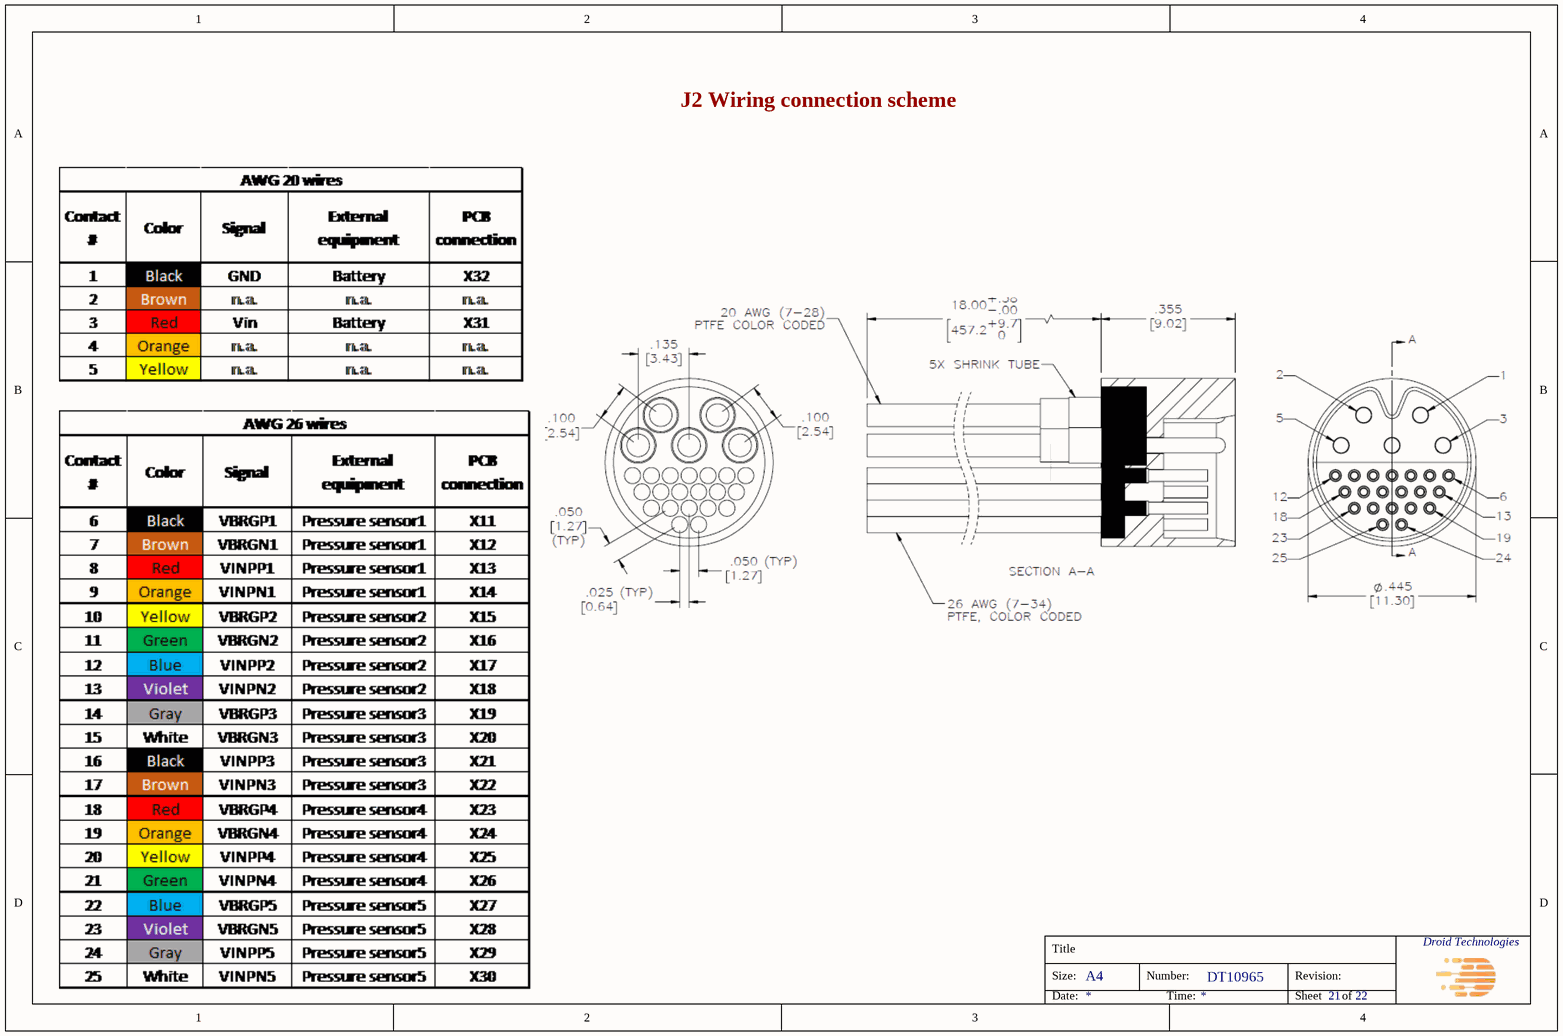
[diagram p20: Wiring_connection_scheme_J2.SchDoc]

### Notes on the sheet
- J2 Wiring connection scheme
- Title
- Size:
- A4
- Number:
- Revision:
- Date:
- Time:
- Sheet
- of

## Sheet Wiring_connection_scheme_J3.SchDoc: =DT_SCH_Title
size A4; Organization: Droid Technologies; DocumentNumber: DT10965; Revision: 1.0; SheetNumber: 22; SheetTotal: 22
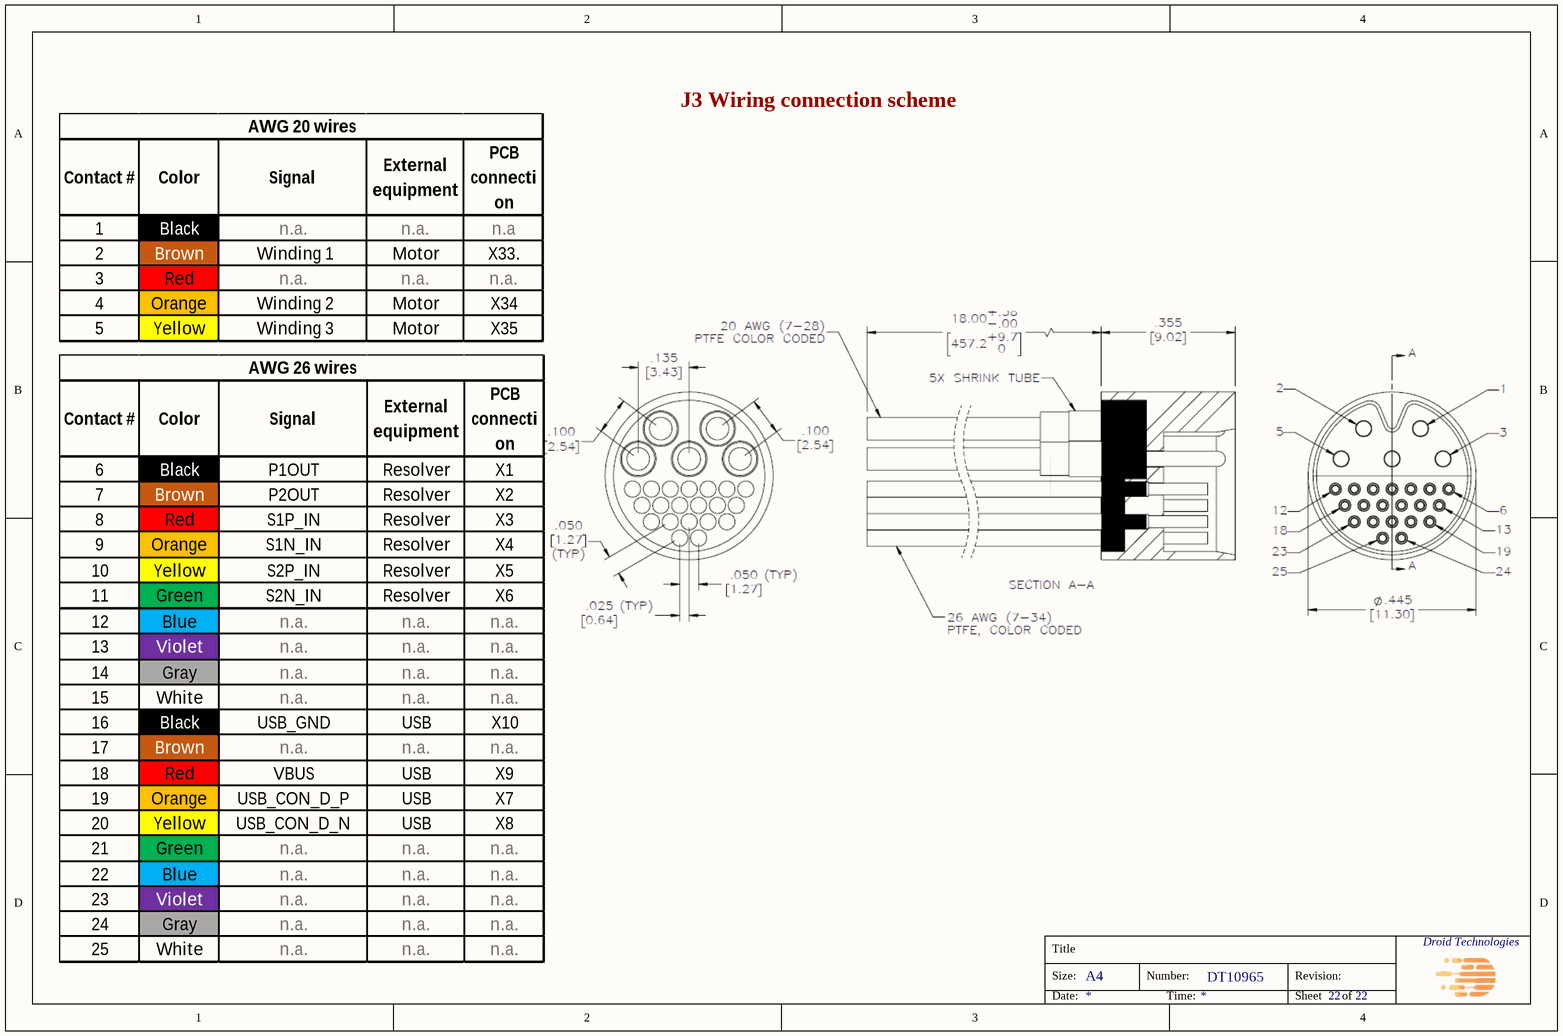
[diagram p21: Wiring_connection_scheme_J3.SchDoc]

### Notes on the sheet
- J3 Wiring connection scheme
- Title
- Size:
- A4
- Number:
- Revision:
- Date:
- Time:
- Sheet
- of